# EAGLE schematic Chronos (EAGLE 9.7.0)
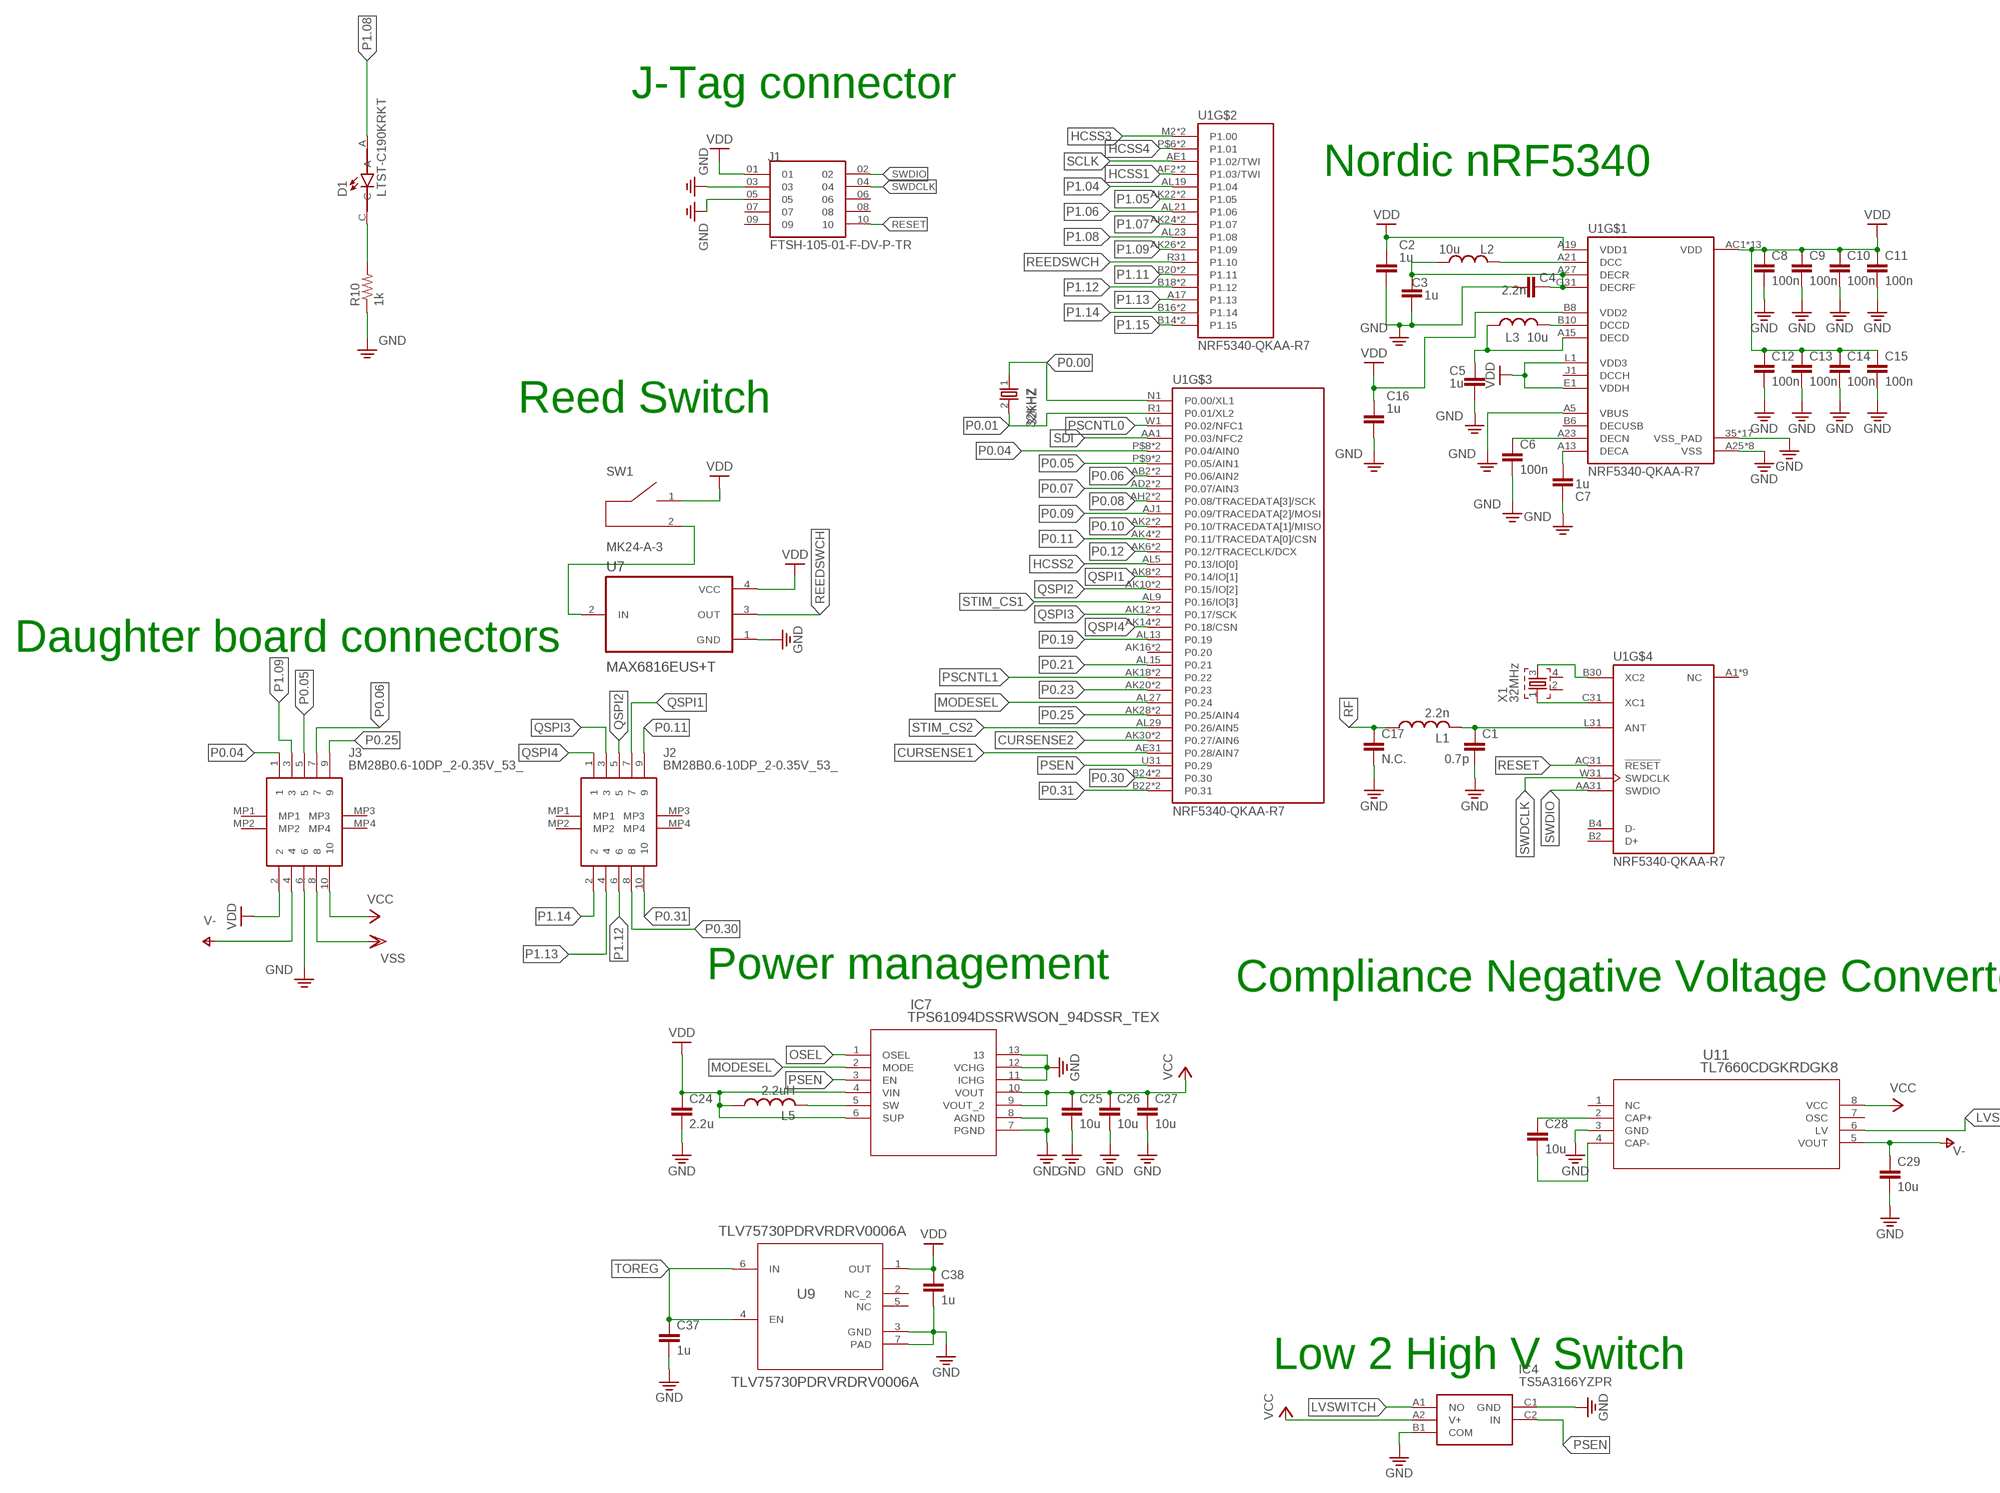
[diagram p0: schematic, sheet 1, part 1 of 3]
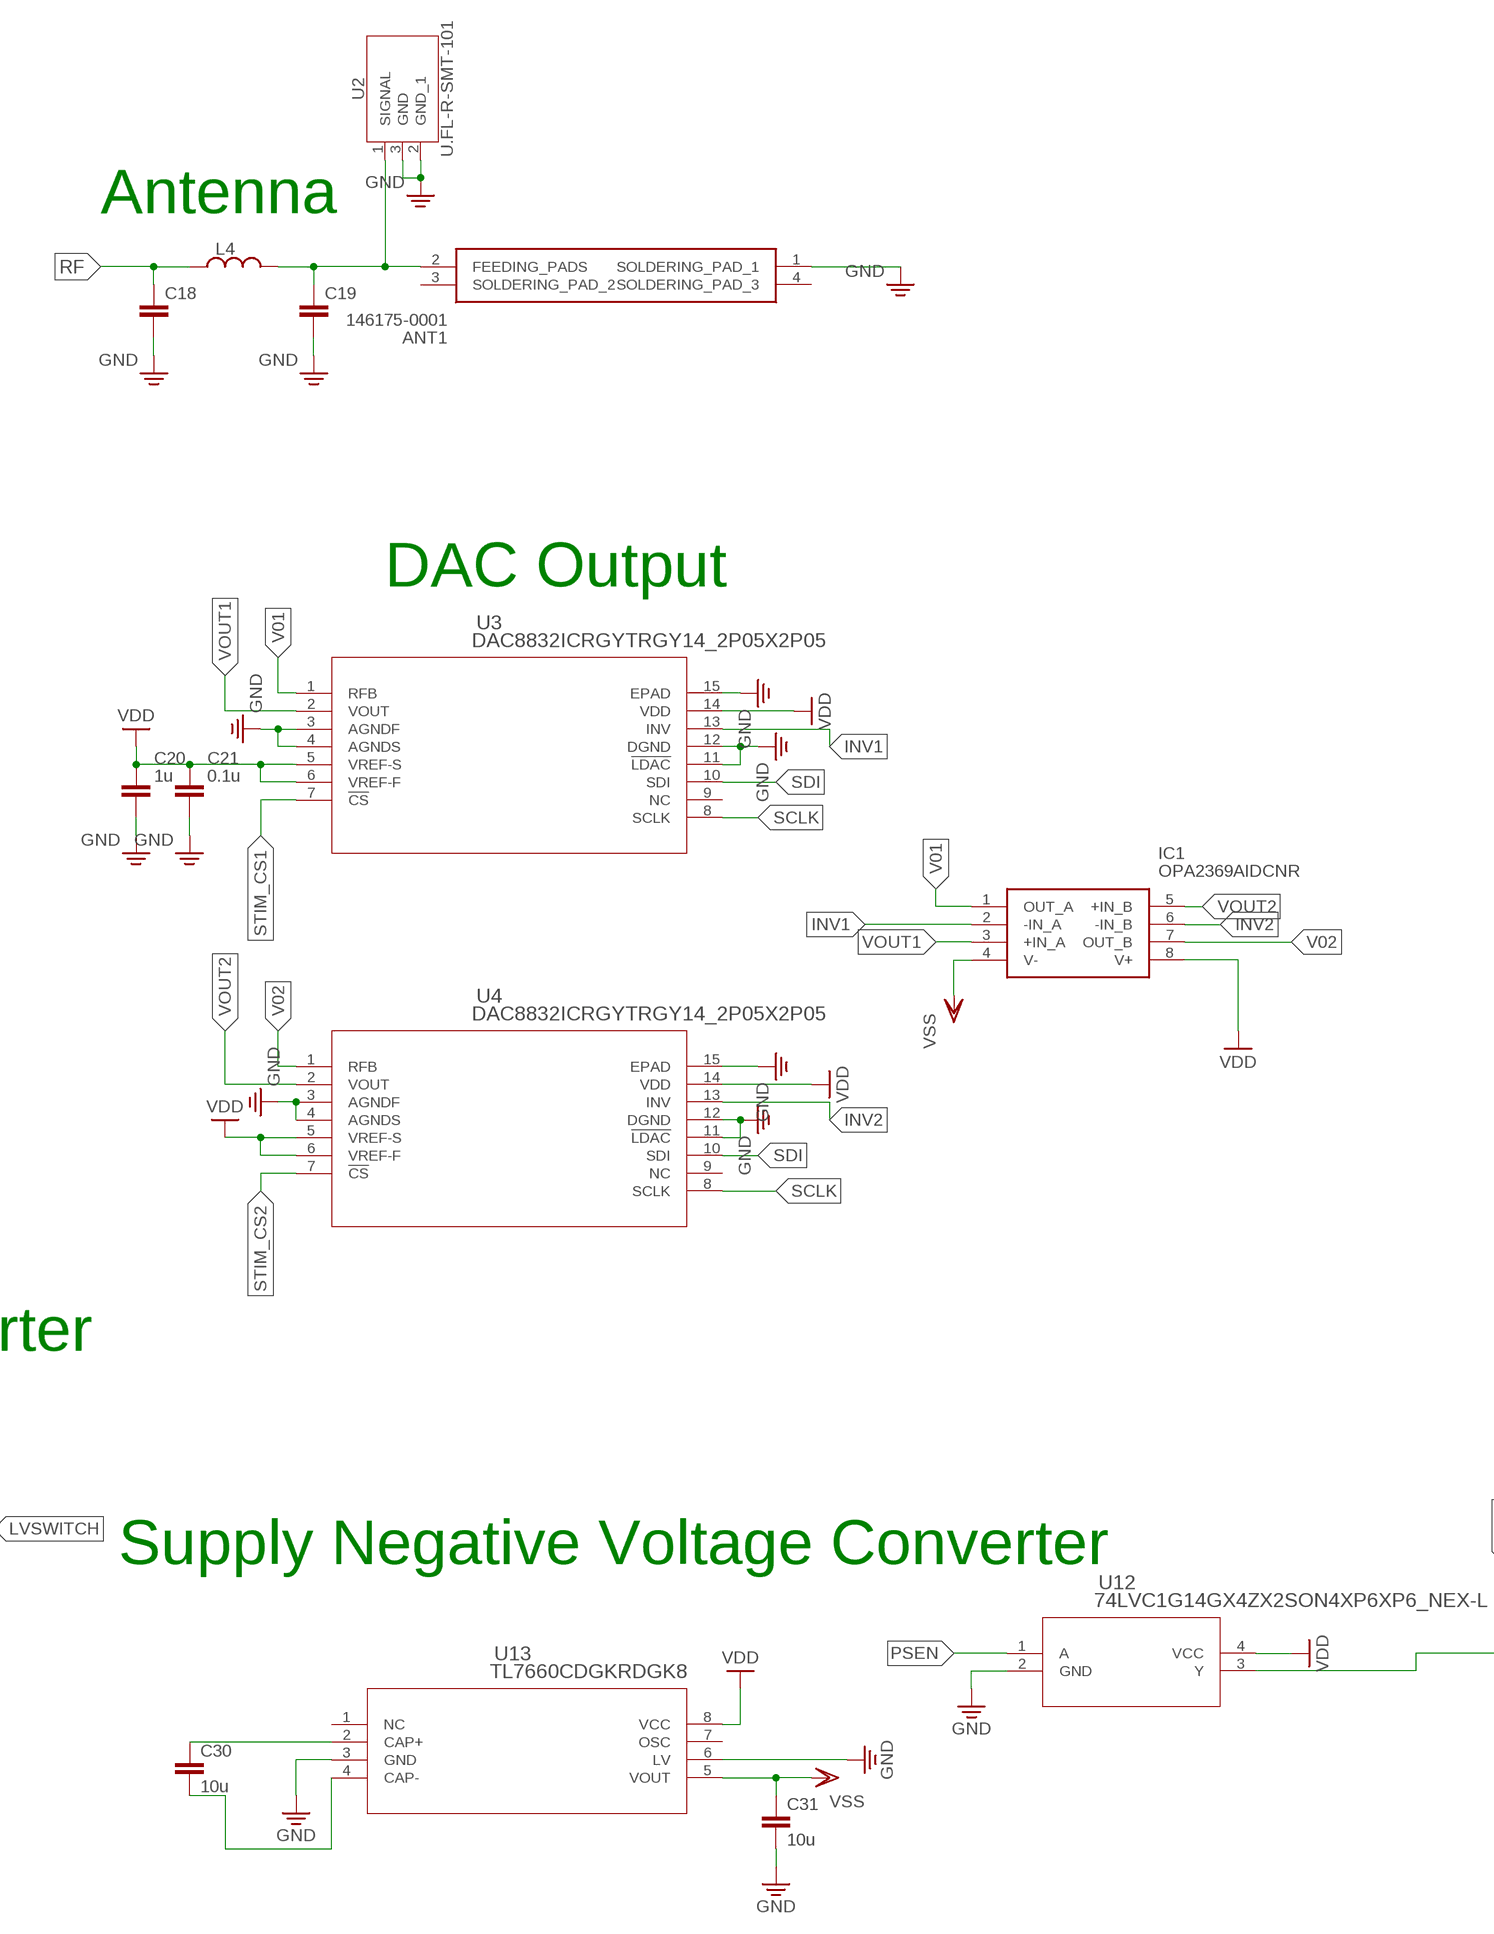
[diagram p1: schematic, sheet 1, part 2 of 3]
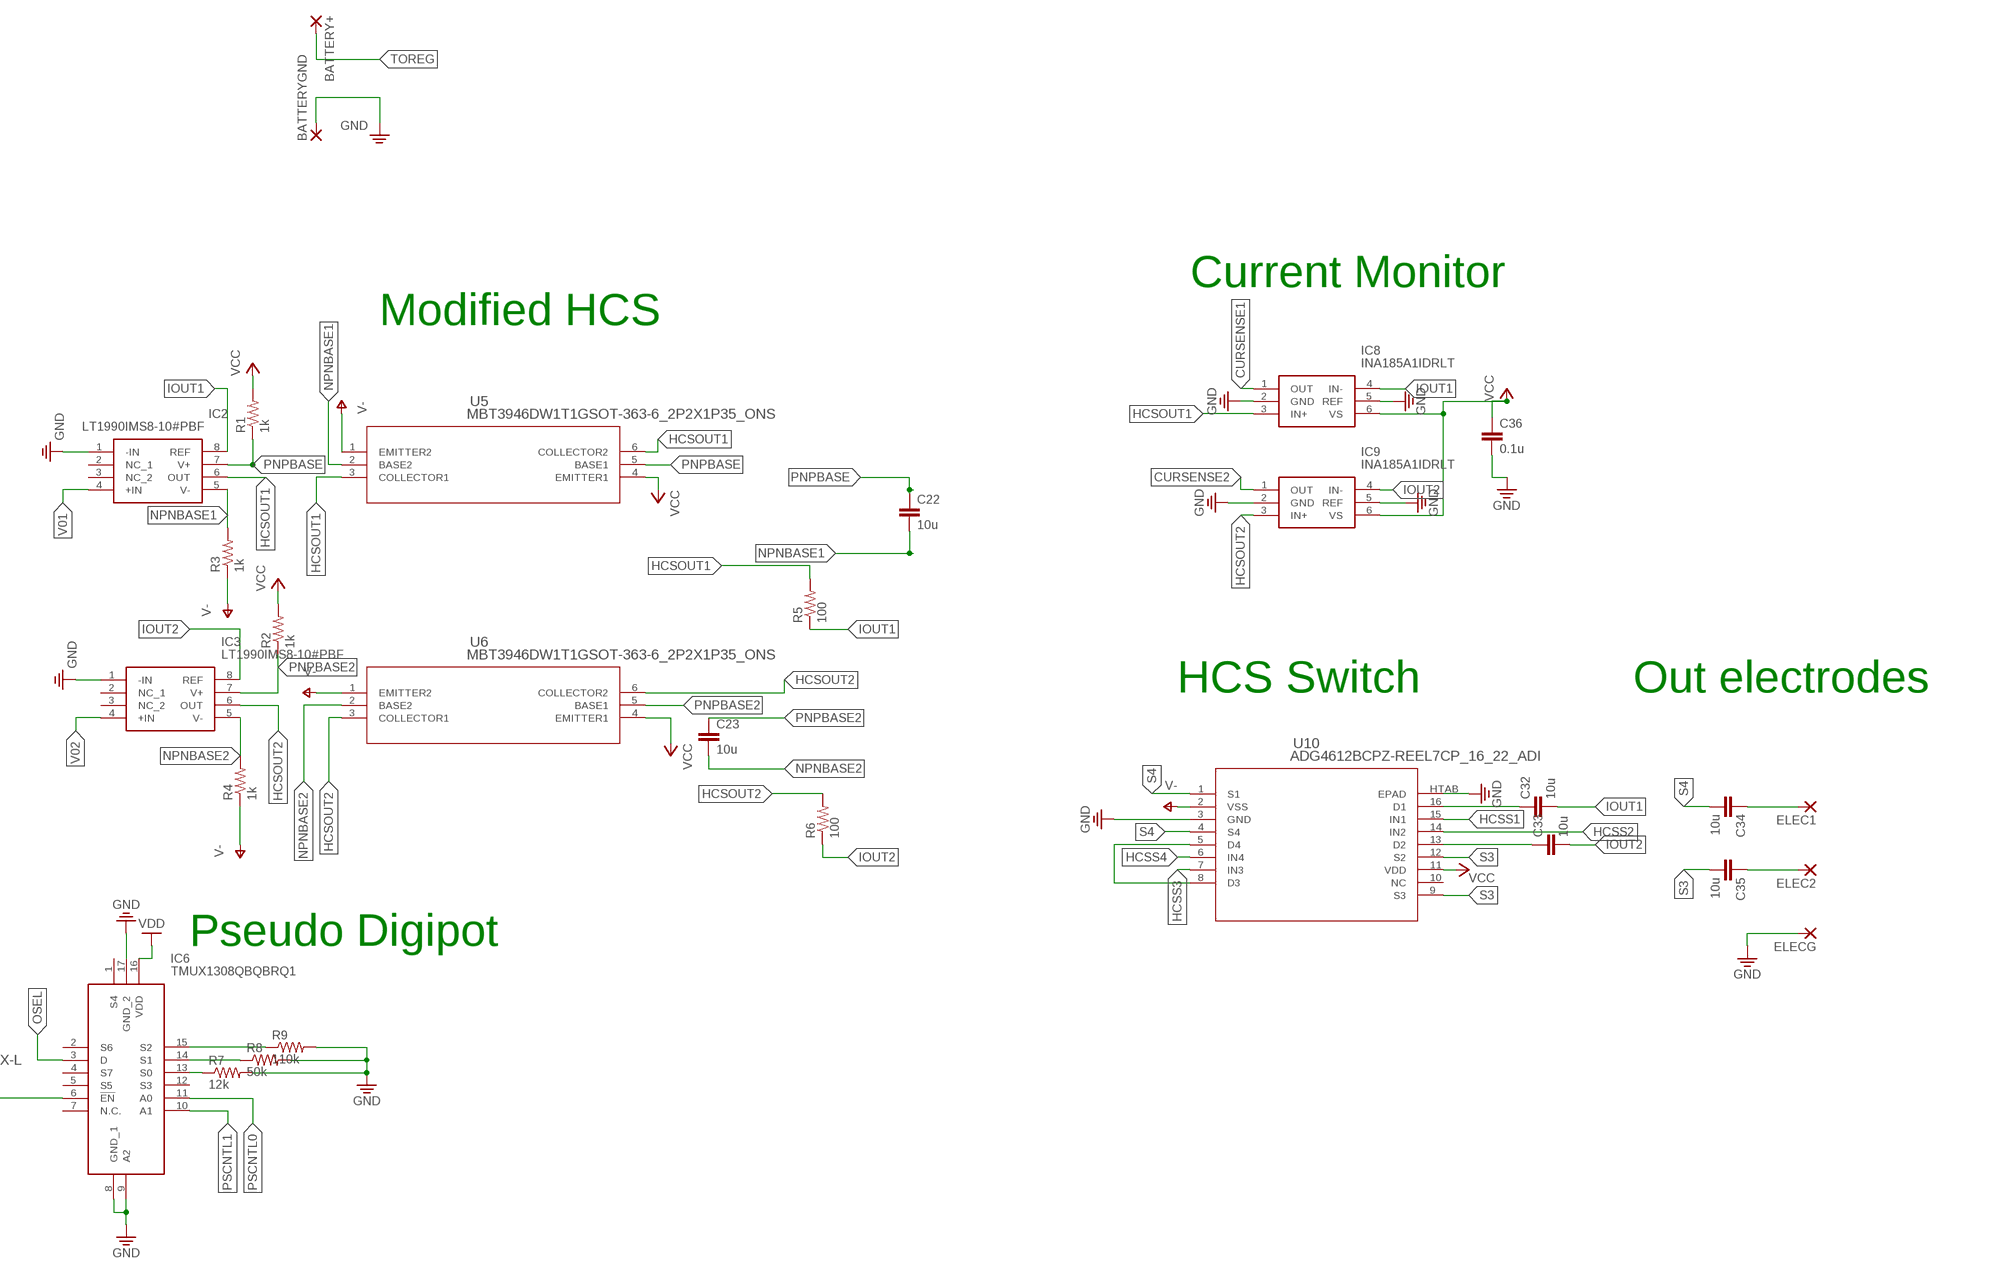
[diagram p2: schematic, sheet 1, part 3 of 3]

## Parts
32KHZ  32kHZ  XTAL_32KHZ  [XTAL_3215_N]
ANT1  146175-0001  [1461750001]
BATTERY+  WIREPADSMD1,27-254  [SMD1,27-2,54]
BATTERYGND  WIREPADSMD1,27-254  [SMD1,27-2,54]
C1  0.7p  CAPACITOR_0201_N  [RESC0201_N]
C2  1u  C_CHIP-0402(1005-METRIC)  [CAPC1005X60]
C3  1u  C_CHIP-0402(1005-METRIC)  [CAPC1005X60]
C4  2.2n  CAPACITOR_0201_N  [RESC0201_N]
C5  1u  C_CHIP-0402(1005-METRIC)  [CAPC1005X60]
C6  100n  CAPACITOR_0201_N  [RESC0201_N]
C7  1u  C_CHIP-0402(1005-METRIC)  [CAPC1005X60]
C8  100n  CAPACITOR_0201_N  [RESC0201_N]
C9  100n  CAPACITOR_0201_N  [RESC0201_N]
C10  100n  CAPACITOR_0201_N  [RESC0201_N]
C11  100n  CAPACITOR_0201_N  [RESC0201_N]
C12  100n  CAPACITOR_0201_N  [RESC0201_N]
C13  100n  CAPACITOR_0201_N  [RESC0201_N]
C14  100n  CAPACITOR_0201_N  [RESC0201_N]
C15  100n  CAPACITOR_0201_N  [RESC0201_N]
C16  1u  C_CHIP-0402(1005-METRIC)  [CAPC1005X60]
C17  N.C.  CAPACITOR_0201_N  [RESC0201_N]
C18  CAPACITOR_0201_L  [RESC0201_L]
C19  CAPACITOR_0201_L  [RESC0201_L]
C20  1u  C_CHIP-0402(1005-METRIC)  [CAPC1005X60]
C21  0.1u  C_CHIP-0402(1005-METRIC)  [CAPC1005X60]
C22  10u  CAPACITOR_0201_L  [RESC0201_L]
C23  10u  CAPACITOR_0201_L  [RESC0201_L]
C24  2.2u  CAPACITOR_0201_L  [RESC0201_L]
C25  10u  CAPACITOR_0201_L  [RESC0201_L]
C26  10u  CAPACITOR_0201_L  [RESC0201_L]
C27  10u  CAPACITOR_0201_L  [RESC0201_L]
C28  10u  CAPACITOR_0201_L  [RESC0201_L]
C29  10u  CAPACITOR_0201_L  [RESC0201_L]
C30  10u  CAPACITOR_0201_L  [RESC0201_L]
C31  10u  CAPACITOR_0201_L  [RESC0201_L]
C32  10u  CAPACITOR_0201_L  [RESC0201_L]
C33  10u  CAPACITOR_0201_L  [RESC0201_L]
C34  10u  CAPACITOR_0201_L  [RESC0201_L]
C35  10u  CAPACITOR_0201_L  [RESC0201_L]
C36  0.1u  CAPACITOR_0201_L  [RESC0201_L]
C37  1u  CAPACITOR_0201_L  [RESC0201_L]
C38  1u  CAPACITOR_0201_L  [RESC0201_L]
D1  LTST-C190KRKT  [LEDC1608X35N]
ELEC1  WIREPADSMD1,27-254  [SMD1,27-2,54]
ELEC2  WIREPADSMD1,27-254  [SMD1,27-2,54]
ELECG  WIREPADSMD1,27-254  [SMD1,27-2,54]
IC1  OPA2369AIDCNR  [SOT65P280X145-8N]
IC2  LT1990IMS8-10#PBF  [SOP65P490X110-8N]
IC3  LT1990IMS8-10#PBF  [SOP65P490X110-8N]
IC4  TS5A3166YZPR  [BGA5C50P2X3_89X139X50]
IC6  TMUX1308QBQBRQ1  [TMUX1308QBQBRQ1]
IC7  TPS61094DSSRWSON_94DSSR_TEX  [WSON_94DSSR_TEX]
IC8  INA185A1IDRLT  [SOTFL50P160X60-6N]
IC9  INA185A1IDRLT  [SOTFL50P160X60-6N]
J1  FTSH-105-01-F-DV-P-TR  [SAMTEC_FTSH-105-01-F-DV-P-TR]
J2  BM28B0.6-10DP_2-0.35V_53_  [BM28B0610DP2035V53]
J3  BM28B0.6-10DP_2-0.35V_53_  [BM28B0610DP2035V53]
L1  2.2n  INDUCTOR_0201_N  [RESC0201_N]
L2  10u  L_CHIP-0603(1608-METRIC)  [INDC1608X95N]
L3  10u  L_CHIP-0603(1608-METRIC)  [INDC1608X95N]
L4  L_CHIP-0402(1006-METRIC)  [INDC1006X60N]
L5  2.2uH  INDUCTOR_0805_N  [RESC0805_N]
R1  1k  R-US_R0201  [R0201]
R2  1k  R-US_R0201  [R0201]
R3  1k  R-US_R0201  [R0201]
R4  1k  R-US_R0201  [R0201]
R5  100  R-US_R0201  [R0201]
R6  100  R-US_R0201  [R0201]
R7  12k  R-US_R0201  [R0201]
R8  50k  R-US_R0201  [R0201]
R9  110k  R-US_R0201  [R0201]
R10  1k  R-US_R0201  [R0201]
SW1  MK24-A-3  [SENSOR_MK24-A-3]
U1  NRF5340-QKAA-R7  [XCVR_NRF5340-QKAA-R7]
U2  U.FL-R-SMT-101  [U.FL-R-SMT-1(XX)]
U3  DAC8832ICRGYTRGY14_2P05X2P05  [RGY14_2P05X2P05]
U4  DAC8832ICRGYTRGY14_2P05X2P05  [RGY14_2P05X2P05]
U5  MBT3946DW1T1GSOT-363-6_2P2X1P35_ONS  [SOT-363-6_2P2X1P35_ONS]
U6  MBT3946DW1T1GSOT-363-6_2P2X1P35_ONS  [SOT-363-6_2P2X1P35_ONS]
U7  MAX6816EUS+T  [SOT192P237X122-4N]
U9  TLV75730PDRVRDRV0006A  [DRV0006A]
U10  ADG4612BCPZ-REEL7CP_16_22_ADI  [CP_16_22_ADI]
U11  TL7660CDGKRDGK8  [DGK8]
U12  74LVC1G14GX4ZX2SON4XP6XP6_NEX-L  [X2SON4XP6XP6_NEX-L]
U13  TL7660CDGKRDGK8  [DGK8]
X1  32MHz  XTAL_32MHZ  [BT-XTAL_2016_N]

## Nets
CURSENSE1: IC8.1(OUT) U1.AE31(P0.28/AIN7)
CURSENSE2: IC9.1(OUT) U1.AK30(P0.27/AIN6) U1.P$28(P0.27/AIN6)
GND: ANT1.1(SOLDERING_PAD_1) BATTERYGND.1(P) C1.2 C2.2 C3.2 C4.2 C5.2 C6.2 C7.2 C8.2 C9.2 C10.2 C11.2 C12.2 C13.2 C14.2 C15.2 C16.2 C17.2 C18.2 C19.2 C20.2 C21.2 C24.2 C25.2 C26.2 C27.2 C29.2 C31.2 C36.2 C37.2 C38.2 ELECG.1(P) IC2.1(-IN) IC3.1(-IN) IC4.B1(COM) IC4.C1(GND) IC6.8(GND_1) IC6.9(A2) IC6.17(GND_2) IC7.7(PGND) IC7.8(AGND) IC7.11(ICHG) IC7.12(VCHG) IC7.13 IC8.2(GND) IC8.5(REF) IC9.2(GND) IC9.5(REF) J1.03 J1.05 J3.6 R7.2 R8.2 R9.2 R10.1 U1.35(VSS_PAD) U1.36(VSS_PAD) U1.37(VSS_PAD) U1.38(VSS_PAD) U1.39(VSS_PAD) U1.40(VSS_PAD) U1.41(VSS_PAD) U1.43(VSS_PAD) U1.44(VSS_PAD) U1.45(VSS_PAD) U1.46(VSS_PAD) U1.47(VSS_PAD) U1.48(VSS_PAD) U1.49(VSS_PAD) U1.50(VSS_PAD) U1.51(VSS_PAD) U1.104(VSS_PAD) U1.A5(VBUS) U1.A25(VSS) U1.B12(VSS) U1.B26(VSS) U1.G1(VSS) U1.H2(VSS) U1.J31(VSS) U1.P$3(VSS) U1.P$35(VSS) U2.2(GND_1) U2.3(GND) U3.3(AGNDF) U3.4(AGNDS) U3.11(!LDAC) U3.12(DGND) U3.15(EPAD) U4.3(AGNDF) U4.4(AGNDS) U4.11(!LDAC) U4.12(DGND) U4.15(EPAD) U7.1(GND) U9.3(GND) U9.7(PAD) U10.3(GND) U10.HTAB(EPAD) U11.3(GND) U12.2(GND) U13.3(GND) U13.6(LV)
HCSOUT1: IC2.6(OUT) IC8.3(IN+) R5.2 U5.3(COLLECTOR1) U5.6(COLLECTOR2)
HCSOUT2: IC3.6(OUT) IC9.3(IN+) R6.2 U6.3(COLLECTOR1) U6.6(COLLECTOR2)
HCSS1: U1.AF2(P1.03/TWI) U1.P$12(P1.03/TWI) U10.15(IN1)
HCSS2: U1.AL5(P0.13/IO[0]) U10.14(IN2)
HCSS3: U1.M2(P1.00) U1.P$5(P1.00) U10.7(IN3)
HCSS4: U1.P2(P1.01) U1.P$6(P1.01) U10.6(IN4)
INV1: IC1.2(-IN_A) U3.13(INV)
INV2: IC1.6(-IN_B) U4.13(INV)
IOUT1: C32.2 IC2.8(REF) IC8.4(IN-) R5.1
IOUT2: C33.2 IC3.8(REF) IC9.4(IN-) R6.1
LVSWITCH: IC4.A1(NO) U11.6(LV)
MODESEL: IC7.2(MODE) U1.AL27(P0.24)
N$1: C1.1 L1.2 U1.L31(ANT)
N$2: U1.C31(XC1) X1.1
N$3: U1.B30(XC2) X1.3
N$4: C6.1 U1.A23(DECN)
N$5: L2.2 U1.A21(DCC)
N$6: L3.2 U1.B10(DCCD)
N$7: C5.1 L3.1 U1.A15(DECD)
N$8: C3.1 C4.1 L2.1 U1.A27(DECR) U1.G31(DECRF)
N$9: C7.1 U1.A13(DECA)
N$10: SW1.2 U7.2(IN)
N$11: ANT1.2(FEEDING_PADS) C19.1 L4.2 U2.1(SIGNAL)
N$12: IC7.5(SW) L5.2
N$13: C28.1 U11.2(CAP+)
N$14: C28.2 U11.4(CAP-)
N$15: C30.1 U13.2(CAP+)
N$16: C30.2 U13.4(CAP-)
N$17: IC6.13(S0) R7.1
N$18: IC6.14(S1) R8.1
N$19: IC6.15(S2) R9.1
N$20: IC6.6(!EN) U12.3(Y)
N$21: C32.1 U10.16(D1)
N$22: C33.1 U10.13(D2)
N$23: C34.1 ELEC1.1(P)
N$24: U10.5(D4) U10.8(D3)
N$25: C35.1 ELEC2.1(P)
N$26: D1.C R10.2
NPNBASE1: C22.2 IC2.5(V-) R3.2 U5.2(BASE2)
NPNBASE2: C23.2 IC3.5(V-) R4.2 U6.2(BASE2)
OSEL: IC6.3(D) IC7.1(OSEL)
P0.00: 32KHZ.1 U1.N1(P0.00/XL1)
P0.01: 32KHZ.2 U1.R1(P0.01/XL2)
P0.04: J3.1 U1.P$8(P0.04/AIN0) U1.V2(P0.04/AIN0)
P0.05: J3.5 U1.P$9(P0.05/AIN1) U1.Y2(P0.05/AIN1)
P0.06: J3.7 U1.AB2(P0.06/AIN2) U1.P$10(P0.06/AIN2)
P0.07: U1.AD2(P0.07/AIN3) U1.P$11(P0.07/AIN3)
P0.08: U1.AH2(P0.08/TRACEDATA[3]/SCK) U1.P$13(P0.08/TRACEDATA[3]/SCK)
P0.09: U1.AJ1(P0.09/TRACEDATA[2]/MOSI)
P0.10: U1.AK2(P0.10/TRACEDATA[1]/MISO) U1.P$14(P0.10/TRACEDATA[1]/MISO)
P0.11: J2.9 U1.AK4(P0.11/TRACEDATA[0]/CSN) U1.P$15(P0.11/TRACEDATA[0]/CSN)
P0.12: U1.AK6(P0.12/TRACECLK/DCX) U1.P$16(P0.12/TRACECLK/DCX)
P0.19: U1.AL13(P0.19)
P0.21: U1.AL15(P0.21)
P0.23: U1.AK20(P0.23) U1.P$23(P0.23)
P0.25: J3.9 U1.AK28(P0.25/AIN4) U1.P$27(P0.25/AIN4)
P0.30: J2.8 U1.B24(P0.30) U1.P$34(P0.30)
P0.31: J2.10 U1.B22(P0.31) U1.P$33(P0.31)
P1.04: U1.AL19(P1.04)
P1.05: U1.AK22(P1.05) U1.P$24(P1.05)
P1.06: U1.AL21(P1.06)
P1.07: U1.AK24(P1.07) U1.P$25(P1.07)
P1.08: D1.A U1.AL23(P1.08)
P1.09: J3.3 U1.AK26(P1.09) U1.P$26(P1.09)
P1.11: U1.B20(P1.11) U1.P$32(P1.11)
P1.12: J2.6 U1.B18(P1.12) U1.P$31(P1.12)
P1.13: J2.4 U1.A17(P1.13)
P1.14: J2.2 U1.B16(P1.14) U1.P$30(P1.14)
P1.15: U1.B14(P1.15) U1.P$29(P1.15)
PNPBASE: C22.1 IC2.7(V+) R1.1 U5.5(BASE1)
PNPBASE2: C23.1 IC3.7(V+) R2.1 U6.5(BASE1)
PSCNTL0: IC6.11(A0) U1.W1(P0.02/NFC1)
PSCNTL1: IC6.10(A1) U1.AK18(P0.22) U1.P$22(P0.22)
PSEN: IC4.C2(IN) IC7.3(EN) U1.U31(P0.29) U12.1(A)
QSPI1: J2.7 U1.AK8(P0.14/IO[1]) U1.P$17(P0.14/IO[1])
QSPI2: J2.5 U1.AK10(P0.15/IO[2]) U1.P$18(P0.15/IO[2])
QSPI3: J2.3 U1.AK12(P0.17/SCK) U1.P$19(P0.17/SCK)
QSPI4: J2.1 U1.AK14(P0.18/CSN) U1.P$20(P0.18/CSN)
REEDSWCH: U1.R31(P1.10) U7.3(OUT)
RESET: J1.10 U1.AC31(!RESET)
RF: C17.1 C18.1 L1.1 L4.1
S3: C35.2 U10.9(S3) U10.12(S2)
S4: C34.2 U10.1(S1) U10.4(S4)
SCLK: U1.AE1(P1.02/TWI) U3.8(SCLK) U4.8(SCLK)
SDI: U1.AA1(P0.03/NFC2) U3.10(SDI) U4.10(SDI)
STIM_CS1: U1.AL9(P0.16/IO[3]) U3.7(!CS)
STIM_CS2: U1.AL29(P0.26/AIN5) U4.7(!CS)
SWDCLK: J1.04 U1.W31(SWDCLK)
SWDIO: J1.02 U1.AA31(SWDIO)
TOREG: BATTERY+.1(P) C37.1 U9.4(EN) U9.6(IN)
V01: IC1.1(OUT_A) IC2.4(+IN) U3.1(RFB)
V02: IC1.7(OUT_B) IC3.4(+IN) U4.1(RFB)
V-: C29.1 J3.4 R3.1 R4.1 U5.1(EMITTER2) U6.1(EMITTER2) U10.2(VSS) U11.5(VOUT)
VCC: C25.1 C26.1 C27.1 C36.1 IC4.A2(V+) IC7.9(VOUT_2) IC7.10(VOUT) IC8.6(VS) IC9.6(VS) J3.10 R1.2 R2.2 U5.4(EMITTER1) U6.4(EMITTER1) U10.11(VDD) U11.8(VCC)
VDD: C2.1 C8.1 C9.1 C10.1 C11.1 C12.1 C13.1 C14.1 C15.1 C16.1 C20.1 C21.1 C24.1 C38.1 IC1.8(V+) IC6.16(VDD) IC7.4(VIN) IC7.6(SUP) J1.01 J3.2 L5.1 SW1.1 U1.A19(VDD1) U1.AC1(VDD) U1.AG1(VDD) U1.AJ31(VDD) U1.AL3(VDD) U1.AL7(VDD) U1.AL11(VDD) U1.AL17(VDD) U1.AL25(VDD) U1.B8(VDD2) U1.B28(VDD) U1.C1(VDD) U1.E1(VDDH) U1.E31(VDD) U1.L1(VDD3) U1.N31(VDD) U1.U1(VDD) U3.5(VREF-S) U3.6(VREF-F) U3.14(VDD) U4.5(VREF-S) U4.6(VREF-F) U4.14(VDD) U7.4(VCC) U9.1(OUT) U12.4(VCC) U13.8(VCC)
VOUT1: IC1.3(+IN_A) U3.2(VOUT)
VOUT2: IC1.5(+IN_B) U4.2(VOUT)
VSS: C31.1 IC1.4(V-) J3.8 U13.5(VOUT)
Unconnected: ANT1.3(SOLDERING_PAD_2) ANT1.4(SOLDERING_PAD_3) IC2.2(NC_1) IC2.3(NC_2) IC3.2(NC_1) IC3.3(NC_2) IC6.1(S4) IC6.2(S6) IC6.4(S7) IC6.5(S5) IC6.7(N.C.) IC6.12(S3) J1.06 J1.07 J1.08 J1.09 J2.MP1 J2.MP2 J2.MP3 J2.MP4 J3.MP1 J3.MP2 J3.MP3 J3.MP4 U1.A1(NC) U1.A31(NC) U1.AG31(NC) U1.AK16(P0.20) U1.AL1(NC) U1.AL31(NC) U1.B2(D+) U1.B4(D-) U1.D2(NC) U1.F2(NC) U1.K2(NC) U1.P$21(P0.20) U1.T2(NC) U3.9(NC) U4.9(NC) U9.2(NC_2) U9.5(NC) U10.10(NC) U11.1(NC) U11.7(OSC) U13.1(NC) U13.7(OSC) X1.2 X1.4

## Notes on the sheet
- J-Tag connector
- Antenna
- Nordic nRF5340
- Reed Switch | Current Monitor
- DAC Output | Modified HCS
- Daughter board connectors
- HCS Switch | Out electrodes
- Power management | Compliance Negative Voltage Converter
- Pseudo Digipot
- Supply Negative Voltage Converter
- Low 2 High V Switch

## Power pins joined to a net without a drawn wire
DCCH: U1.J1(DCCH)
DECUSB: U1.B6(DECUSB)

## Library data of the parts
32KHZ = Nordic_nRF:XTAL_32KHZ
ANT1 = ChronosV5 v10:146175-0001: Antennas 2.4/5GHz SMTOnGround MID Chip Antenna Source: Datasheet <https://www.molex.com/pdm_docs/sd/1461750001_sd.pdf>; DESCRIPTION: Antennas 2.4/5GHz SMTOnGround MID Chip Antenna; HEIGHT: 4.1mm; MANUFACTURER_NAME: Molex; MANUFACTURER_PART_NUMBER: 146175-0001; MOUSER_PART_NUMBER: 538-146175-0001; MOUSER_PRICE-STOCK: https://www.mouser.co.uk/ProductDetail/Molex/146175-0001?qs=XFe3dyCRgQjkov2fyUw2sg%3D%3D
BATTERY+ BATTERYGND ELEC1 ELEC2 ELECG = wirepad:WIREPAD: Wire PAD connect wire on PCB
C1 C4 C6 C8-C15 C17-C19 C22-C38 = ChronosV5 v10:CAPACITOR: Generic chip capacitor
C2 C3 C5 C7 C16 C20 C21 = ChronosV5 v10:C: Capacitor - Generic; CATEGORY: Capacitor
D1 = LTST-C190KRKT:LTST-C190KRKT
IC1 = ChronosV5 v10:OPA2369AIDCNR: 1.8V, 700nA, Zero-Crossover Rail-To-Rail I/O Operational Amplifier Source: Datasheet <http://www.ti.com/lit/gpn/OPA2369>; DESCRIPTION: 1.8V, 700nA, Zero-Crossover Rail-To-Rail I/O Operational Amplifier; HEIGHT: 1.45mm; MANUFACTURER_NAME: Texas Instruments; MANUFACTURER_PART_NUMBER: OPA2369AIDCNR; MOUSER_PART_NUMBER: 595-OPA2369AIDCNR; MOUSER_PRICE-STOCK: https://www.mouser.co.uk/ProductDetail/Texas-Instruments/OPA2369AIDCNR?qs=ToK3%2FczOkx80MGOHG9Fs2Q%3D%3D
IC2 IC3 = LT1990IMS8-10#PBF:LT1990IMS8-10#PBF: SP Amp Difference Amplifier Single R-R O/P +/-18V/36V 8-Pin MSOP Tube Source: Datasheet <https://www.arrow.com/en/products/lt1990ims8-10pbf/analog-devices>; DESCRIPTION: SP Amp Difference Amplifier Single R-R O/P +/-18V/36V 8-Pin MSOP Tube; HEIGHT: 1.1mm; MANUFACTURER_NAME: Analog Devices; MANUFACTURER_PART_NUMBER: LT1990IMS8-10#PBF; MOUSER_PART_NUMBER: 584-LT1990IMS810PB; MOUSER_PRICE-STOCK: https://www.mouser.co.uk/ProductDetail/Analog-Devices/LT1990IMS8-10PBF?qs=%252BEew9%252B0nqrCQeKoCriE%2FkQ%3D%3D
IC4 = TS5A3166YZPR:TS5A3166YZPR: 1-Ohm SPST Analog Switch 5-V/3.3-V Single-Channel Analog Switch Source: Datasheet <http://www.ti.com/lit/gpn/ts5a3166>; DESCRIPTION: 1-Ohm SPST Analog Switch 5-V/3.3-V Single-Channel Analog Switch; HEIGHT: 0.5mm; MANUFACTURER_NAME: Texas Instruments; MANUFACTURER_PART_NUMBER: TS5A3166YZPR; MOUSER_PART_NUMBER: 595-TS5A3166YZPR; MOUSER_PRICE-STOCK: https://www.mouser.co.uk/ProductDetail/Texas-Instruments/TS5A3166YZPR?qs=0O%2FZFlpUpJU4gVFvfof2SQ%3D%3D
IC6 = TMUX1308QBQBRQ1:TMUX1308QBQBRQ1: Multiplexer Switch ICs Automotive 5-V, 8:1, 1-channel multiplexer with injection current control and 1.8V logic 16-WQFN -40 to 125 Source: Datasheet <https://www.ti.com/lit/ds/symlink/tmux1308-q1.pdf?HQS=dis-mous-null-mousermode-dsf-pf-null-wwe&ts=1673516051221&ref_url=https%3A%2F%2Fwww.mouser.in%2F>; DESCRIPTION: Multiplexer Switch ICs Automotive 5-V, 8:1, 1-channel multiplexer with injection current control and 1.8V logic 16-WQFN -40 to 125; HEIGHT: 0.8mm; MANUFACTURER_NAME: Texas Instruments; MANUFACTURER_PART_NUMBER: TMUX1308QBQBRQ1; MOUSER_PART_NUMBER: 595-TMUX1308QBQBRQ1; MOUSER_PRICE-STOCK: https://www.mouser.co.uk/ProductDetail/Texas-Instruments/TMUX1308QBQBRQ1?qs=DPoM0jnrROUPOjFt4qoeqA%3D%3D
IC7 = ChronosV5 v10:TPS61094DSSR; COPYRIGHT: Copyright (C) 2023 Ultra Librarian. All rights reserved.; MANUFACTURER_PART_NUMBER: TPS61094DSSR; MFR_NAME: Texas Instruments
IC8 IC9 = INA185A1IDRLT:INA185A1IDRLT: 26V, 350kHz, bi-directional, high-precision current sense amplifier in ultra small (sot-563) package Source: Datasheet <https://www.ti.com/lit/gpn/INA185>; DESCRIPTION: 26V, 350kHz, bi-directional, high-precision current sense amplifier in ultra small (sot-563) package; HEIGHT: 0.6mm; MANUFACTURER_NAME: Texas Instruments; MANUFACTURER_PART_NUMBER: INA185A1IDRLT; MOUSER_PART_NUMBER: 595-INA185A1IDRLT; MOUSER_PRICE-STOCK: https://www.mouser.co.uk/ProductDetail/Texas-Instruments/INA185A1IDRLT?qs=vLWxofP3U2wjelD5NTSNoA%3D%3D
J1 = FTSH-105-01-F-DV-P-TR:FTSH-105-01-F-DV-P-TR; MANUFACTURER: Samtec; PARTREV: R; STANDARD: Manufacturer Recommendations
J2 J3 = BM28B0.6-10DP_2-0.35V_53_:BM28B0.6-10DP_2-0.35V_53_: Board to Board & Mezzanine Connectors 10P Header Straight SMT Source: Datasheet <https://www.hirose.com/product/download/?distributor=digikey&type=2d&lang=en&num=BM28B0.6-10DP/2-0.35V(53)>; DESCRIPTION: Board to Board & Mezzanine Connectors 10P Header Straight SMT; HEIGHT: 0.565mm; MANUFACTURER_NAME: Hirose; MANUFACTURER_PART_NUMBER: BM28B0.6-10DP/2-0.35V(53); MOUSER_PART_NUMBER: 798-28B0610DP2035V53; MOUSER_PRICE-STOCK: https://www.mouser.co.uk/ProductDetail/Hirose-Connector/BM28B0.6-10DP-2-0.35V53?qs=1mbolxNpo8d%2FBisPUm0bOw%3D%3D
L1 L5 = ChronosV5 v10:INDUCTOR: Generic chip inductor
L2-L4 = Inductor:L: Inductor Fixed - Generic; CATEGORY: Inductor; SUB-CATEGORY: Fixed
R1-R10 = rcl:R-US_: RESISTOR, American symbol; SPICEPREFIX: R
SW1 = MK24-A-3:MK24-A-3: Reed Sensor 23-50at j-Lead; MANUFACTURER: Standex-Meder Electronics; PARTREV: 6; STANDARD: Manufacturer Recommendation
U1 = NRF5340-aQFN:NRF5340-QKAA-R7; MANUFACTURER: Nordic Semiconductor; MAXIMUM_PACKAGE_HEIGHT: 0.85mm; PARTREV: 1.0; STANDARD: Manufacturer Recommendations
U2 = ChronosV5 v10:U.FL-R-SMT-1: U.FL (UMCC) Connector Receptacle, Male Pin 50Ohm Surface Mount Solder Datasheet <https://media.digikey.com/pdf/Data%20Sheets/Hirose%20PDFs/UFL%20Series.pdf> Drawing <https://www.hirose.com/product/document?clcode=CL0331-0472-2-10&productname=U.FL-R-SMT-1(10)&series=U.FL&documenttype=2DDrawing&lang=en&documentid=0000940684>; CATEGORY: RF Connectors / Coaxial Connectors; DESCRIPTION: Ultra Small Surface Mount Coaxial Connectors; MANUFACTURER: Hirose Electric Co Ltd; MPN: U.FL-R-SMT-1(01); OPERATING_TEMPERATURE: -40˚C to +90˚C; PART_STATUS: Active; PITCH: -; ROHS_COMPLIANCE: RoHS Compliant; SERIES: U.FL; SUBCATEGORY: RF Interconnects; TYPE: Receptacle, Male Pin,Surface Mount
U3 U4 = 2024-10-29_22-15-03_Library:DAC8832ICRGYT; COPYRIGHT: Copyright (C) 2024 Ultra Librarian. All rights reserved.; MANUFACTURER_PART_NUMBER: DAC8832ICRGYT; MFR_NAME: Texas Instruments
U5 U6 = ChronosV5 v10:MBT3946DW1T1G; COPYRIGHT: Copyright (C) 2024 Ultra Librarian. All rights reserved.; MANUFACTURER_PART_NUMBER: MBT3946DW1T1G; MFR_NAME: onsemi
U7 = ChronosV5 v10:MAX6816EUS+T: None Check availability <https://pricing.snapeda.com/parts/MAX6816EUST/Analog%20Devices/view-part?ref=eda>; AVAILABILITY: In Stock; DESCRIPTION: Supervisory Circuits +/-15kV ESD-Protected, Single/Dual/Octal, CMOS Switch Debouncers; MF: Analog Devices; MP: MAX6816EUST; PACKAGE: SOT-143-4 Maxim; PRICE: None; PURCHASE-URL: https://pricing.snapeda.com/search?q=MAX6816EUST&ref=eda
U9 = 2024-11-12_21-34-43_Library:TLV75730PDRVR; COPYRIGHT: Copyright (C) 2024 Ultra Librarian. All rights reserved.; MANUFACTURER_PART_NUMBER: TLV75730PDRVR; MFR_NAME: Texas Instruments; REFDES: RefDes; TYPE: TYPE
U10 = 2025-02-17_21-06-06_Library:ADG4612BCPZ-REEL7; COPYRIGHT: Copyright (C) 2025 Ultra Librarian. All rights reserved.; MANUFACTURER_PART_NUMBER: ADG4612BCPZ-REEL7; MFR_NAME: Analog Devices Inc
U11 U13 = 2025-04-06_22-05-36_Library:TL7660CDGKR; COPYRIGHT: Copyright (C) 2025 Ultra Librarian. All rights reserved.; MANUFACTURER_PART_NUMBER: TL7660CDGKR; MFR_NAME: Texas Instruments
U12 = 2024-11-12_21-13-53_Library:74LVC1G14GX4Z; COPYRIGHT: Copyright (C) 2024 Ultra Librarian. All rights reserved.; MANUFACTURER_PART_NUMBER: 74LVC1G14GX4Z; MFR_NAME: Nexperia
X1 = Nordic_nRF:XTAL_32MHZ